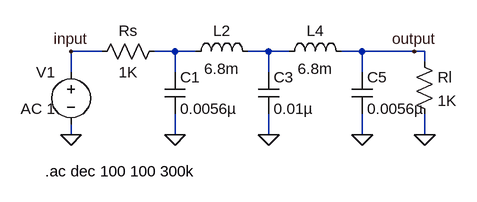
[diagram p0: schematic Draft1.asc]
Draft1.asc, the LTspice schematic file:
Version 4.1
SHEET 1 880 680
WIRE -80 160 -128 160
WIRE 32 160 0 160
WIRE 64 160 32 160
WIRE 176 160 144 160
WIRE 208 160 176 160
WIRE 320 160 288 160
WIRE 400 160 320 160
WIRE 416 160 400 160
WIRE 416 176 416 160
WIRE -128 192 -128 160
WIRE 32 192 32 160
WIRE 176 192 176 160
WIRE 320 192 320 160
WIRE -128 288 -128 272
WIRE 32 288 32 256
WIRE 176 288 176 256
WIRE 320 288 320 256
WIRE 416 288 416 256
FLAG 176 288 0
FLAG 32 288 0
FLAG 320 288 0
FLAG 416 288 0
FLAG -128 288 0
FLAG -128 160 input
FLAG 400 160 output
SYMBOL ind 48 176 R270
WINDOW 0 32 56 VTop 2
WINDOW 3 5 56 VBottom 2
SYMATTR InstName L2
SYMATTR Value 6.8m
SYMATTR SpiceLine Ipk=0.019 Rser=25 Rpar=290005 Cpar=0 mfg="Bourns, Inc." pn="SRR6603-682ML"
SYMBOL ind 192 176 R270
WINDOW 0 32 56 VTop 2
WINDOW 3 5 56 VBottom 2
SYMATTR InstName L4
SYMATTR Value 6.8m
SYMATTR SpiceLine Ipk=0.019 Rser=25 Rpar=290005 Cpar=0 mfg="Bourns, Inc." pn="SRR6603-682ML"
SYMBOL cap 16 192 R0
SYMATTR InstName C1
SYMATTR Value 0.0056µ
SYMATTR SpiceLine V=6.3 Irms=143m Rser=1.14049 Lser=0 mfg="KEMET" pn="C0603C562K9RAC" type="X7R"
SYMBOL cap 160 192 R0
SYMATTR InstName C3
SYMATTR Value 0.01µ
SYMATTR SpiceLine V=4 Irms=162m Rser=0.395426 Lser=0 mfg="KEMET" pn="C0402C103K7PAC" type="X5R"
SYMBOL cap 304 192 R0
SYMATTR InstName C5
SYMATTR Value 0.0056µ
SYMATTR SpiceLine V=6.3 Irms=143m Rser=1.14049 Lser=0 mfg="KEMET" pn="C0603C562K9RAC" type="X7R"
SYMBOL res 400 160 R0
SYMATTR InstName Rl
SYMATTR Value 1K
SYMATTR SpiceLine tol=1 pwr=0.1
SYMBOL res 16 144 R90
WINDOW 0 0 56 VBottom 2
WINDOW 3 32 56 VTop 2
SYMATTR InstName Rs
SYMATTR Value 1K
SYMATTR SpiceLine tol=1 pwr=0.1
SYMBOL voltage -128 176 M0
WINDOW 3 24 44 Left 2
WINDOW 123 24 72 Left 2
WINDOW 39 0 0 Left 0
SYMATTR InstName V1
SYMATTR Value ""
SYMATTR Value2 AC 1
TEXT -168 344 Left 2 !.ac dec 100 100 300k

The netlist it stands for:
* Draft1.asc
L2 N001 N002 6.8m Ipk=0.019 Rser=25 Rpar=290005 Cpar=0 mfg="Bourns, Inc." pn="SRR6603-682ML"
L4 N002 output 6.8m Ipk=0.019 Rser=25 Rpar=290005 Cpar=0 mfg="Bourns, Inc." pn="SRR6603-682ML"
C1 N001 0 0.0056µ V=6.3 Irms=143m Rser=1.14049 Lser=0 mfg="KEMET" pn="C0603C562K9RAC" type="X7R"
C3 N002 0 0.01µ V=4 Irms=162m Rser=0.395426 Lser=0 mfg="KEMET" pn="C0402C103K7PAC" type="X5R"
C5 output 0 0.0056µ V=6.3 Irms=143m Rser=1.14049 Lser=0 mfg="KEMET" pn="C0603C562K9RAC" type="X7R"
Rl output 0 1K tol=1 pwr=0.1
Rs N001 input 1K tol=1 pwr=0.1
V1 input 0 AC 1
.ac dec 100 100 300k
.backanno
.end